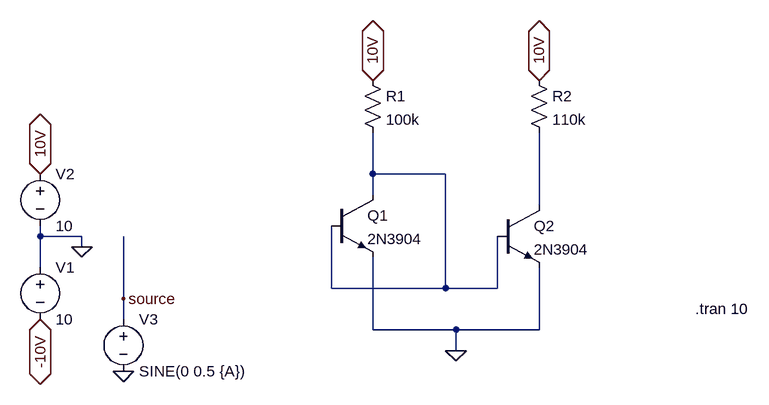
[diagram p0: schematic current_mirror.asc]
current_mirror.asc, the LTspice schematic file:
Version 4
SHEET 1 1144 680
WIRE 320 176 320 112
WIRE 432 176 320 176
WIRE 320 208 320 176
WIRE 576 224 576 112
WIRE -192 272 -192 256
WIRE -128 272 -192 272
WIRE -128 288 -128 272
WIRE -192 320 -192 272
WIRE 256 352 256 256
WIRE 432 352 432 176
WIRE 432 352 256 352
WIRE 512 352 512 272
WIRE 512 352 432 352
WIRE -64 368 -64 272
WIRE -64 400 -64 368
WIRE 320 416 320 304
WIRE 448 416 320 416
WIRE 576 416 576 320
WIRE 576 416 448 416
WIRE 448 448 448 416
FLAG -128 288 0
FLAG -192 400 -10V
IOPIN -192 400 BiDir
FLAG -192 176 10V
IOPIN -192 176 BiDir
FLAG -64 480 0
FLAG -64 368 source
FLAG 448 448 0
FLAG 320 32 10V
IOPIN 320 32 BiDir
FLAG 576 32 10V
IOPIN 576 32 BiDir
SYMBOL Voltage -192 304 R0
SYMATTR InstName V1
SYMATTR Value 10
SYMBOL Voltage -192 160 R0
SYMATTR InstName V2
SYMATTR Value 10
SYMBOL Voltage -64 384 R0
SYMATTR InstName V3
SYMATTR Value SINE(0 0.5 {A})
SYMBOL npn 256 208 R0
SYMATTR InstName Q1
SYMATTR Value 2N3904
SYMBOL npn 512 224 R0
SYMATTR InstName Q2
SYMATTR Value 2N3904
SYMBOL Res 304 16 R0
SYMATTR InstName R1
SYMATTR Value 100k
SYMBOL Res 560 16 R0
SYMATTR InstName R2
SYMATTR Value 110k
TEXT 816 384 Left 2 !.tran 10

The netlist it stands for:
* current_mirror.asc
V1 0 -10V 10
V2 10V 0 10
V3 source 0 SINE(0 0.5 {A})
Q1 N001 N001 0 0 2N3904
Q2 N002 N001 0 0 2N3904
R1 10V N001 100k
R2 10V N002 110k
.model NPN NPN
.model PNP PNP
.lib standard.bjt
.tran 10
.backanno
.end